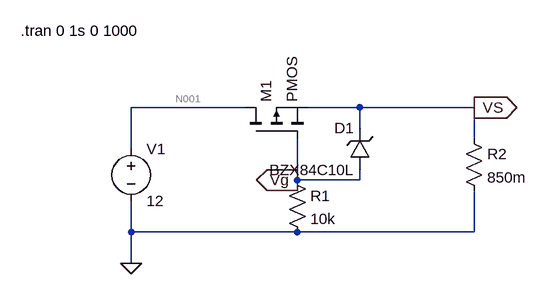
[diagram p0: schematic simulation_inversion_polarite.asc]
simulation_inversion_polarite.asc, the LTspice schematic file:
Version 4
SHEET 1 880 680
WIRE 272 112 96 112
WIRE 448 112 368 112
WIRE 624 112 448 112
WIRE 448 144 448 112
WIRE 624 160 624 112
WIRE 96 176 96 112
WIRE 352 224 352 160
WIRE 448 224 448 208
WIRE 448 224 352 224
WIRE 96 304 96 256
WIRE 352 304 96 304
WIRE 624 304 624 240
WIRE 624 304 352 304
WIRE 96 352 96 304
FLAG 96 352 0
FLAG 624 112 VS
IOPIN 624 112 Out
FLAG 352 224 Vg
IOPIN 352 224 Out
SYMBOL pmos 272 160 R270
SYMATTR InstName M1
SYMBOL voltage 96 160 R0
WINDOW 123 0 0 Left 0
WINDOW 39 0 0 Left 0
SYMATTR InstName V1
SYMATTR Value 12
SYMBOL res 336 208 R0
SYMATTR InstName R1
SYMATTR Value 10k
SYMBOL zener 464 208 R180
WINDOW 0 24 64 Left 2
WINDOW 3 24 0 Left 2
SYMATTR InstName D1
SYMATTR Value BZX84C10L
SYMATTR Description Schottky diode
SYMATTR Type schottky
SYMBOL res 608 144 R0
SYMATTR InstName R2
SYMATTR Value 850m
TEXT -74 -6 Left 2 !.tran 0 1s 0 1000

The netlist it stands for:
* simulation_inversion_polarite.asc
M1 N001 Vg VS VS PMOS
V1 N001 0 12
R1 Vg 0 10k
D1 Vg VS BZX84C10L
R2 VS 0 850m
.model D D
.lib standard.dio
.model NMOS NMOS
.model PMOS PMOS
.lib standard.mos
.tran 0 1s 0 1000
.backanno
.end

* Results of the author's LTspice run, read from the files saved beside the schematic
* Operating Point, zero values left out:
*   V(n001) = 12 V
*   V(vg) = 1.358 V
*   V(vs) = 11.1 V
*   Id(M1) = 13.06 A
*   Ib(M1) = -13.06 A
*   Is(M1) = -183.5 µA
*   I(D1) = -135.8 µA
*   I(R1) = 135.8 µA
*   I(R2) = 13.06 A
*   I(V1) = -13.06 A